# Altium schematic sheet Lamp_Section.SchDoc
size A4; DocumentNumber: 7; SheetNumber: 7; SheetTotal: 8
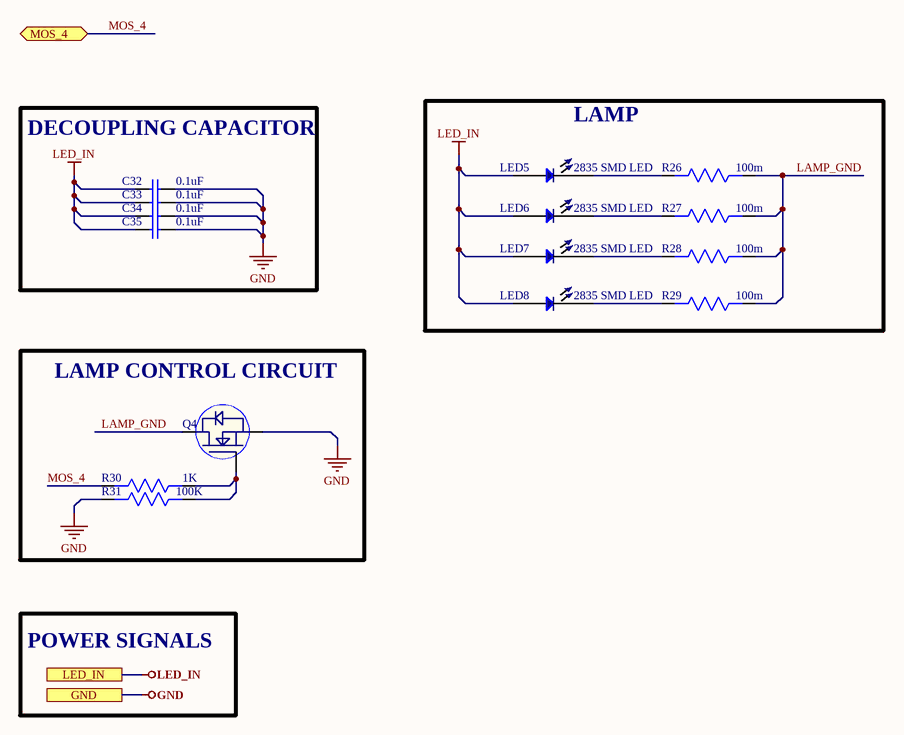
[diagram p0: Lamp_Section.SchDoc]

## Parts
C32  0.1uF  [Cap0603]
C33  0.1uF  [Cap0603]
C34  0.1uF  [Cap0603]
C35  0.1uF  [Cap0603]
LED5  2835 SMD LED  [2835 LED]
LED6  2835 SMD LED  [2835 LED]
LED7  2835 SMD LED  [2835 LED]
LED8  2835 SMD LED  [2835 LED]
Q4  DMN1045UFR4-7  [DMN1045UFR4-7]  (value not drawn)
R26  100m  [Res-1206]
R27  100m  [Res-1206]
R28  100m  [Res-1206]
R29  100m  [Res-1206]
R30  1K  [Res0603]
R31  100K  [Res0603]

## Blocks framed on the sheet
DECOUPLING CAPACITOR: C32-C35
LAMP: LED5-LED8 R26-R29
LAMP CONTROL CIRCUIT: Q4 R30 R31

## Ports
GND, LED_IN, MOS_4 (bidir)

## Nets
GND: C32.2 C33.2 C34.2 C35.2 Q4.2(S) R31.2 ; port GND
LED_IN: C32.1 C33.1 C34.1 C35.1 LED5.1 LED6.1 LED7.1 LED8.1 ; port LED_IN
LAMP_GND: Q4.3(D) R26.1 R27.1 R28.1 R29.1
MOS_4: R30.2 ; port MOS_4
NetLED5_2: LED5.2 R26.2
NetLED6_2: LED6.2 R27.2
NetLED7_2: LED7.2 R28.2
NetLED8_2: LED8.2 R29.2
NetQ4_1: Q4.1(G) R30.1 R31.1

## Notes on the sheet
- POWER SIGNALS

## Library data of the parts
C32-C35 = CC0603ZRY5V9BB104: CAP CER 0.1UF 50V Y5V 0603; Manufacturer: Yageo; Capacitance: 100nF; Tolerance: 80%; Supplier 1: Digi-Key; Manufacturer Part Number: CC0603ZRY5V9BB104; Stock 1: 15000880; Pricing 1: 1=0.1, 10=0.075, 100=0.0334, 500=0.02386, 1000=0.01874 (USD); Mount: Surface Mount; Case/Package: 0603; Number of Pins: 2; Case Code (Metric): 1608; Case Code (Imperial): 0603; Min Operating Temperature: -30°C; Max Operating Temperature: 85°C; Dielectric: Y5V; Voltage Rating: 50V; Package Quantity: 1; Packaging: Tape and Reel; Voltage Rating (DC): 50V; Termination: SMD/SMT; Composition: Ceramic; Voltage: 50V; Length: 1.6mm; Height: 0.8mm; Width: 0.031inch; Thickness: 0.035inch; Depth: 0.8mm; Radiation Hardening: No; REACH SVHC: No SVHC; Lead Free: Lead Free; Halogen Free: Halogen Free; ComponentLink1URL: http://www.yageo.com/documents/recent/UPY-GPHC_Y5V_6.3V-to-50V_8.pdf?src-supplier=Digi-Key; ComponentLink1Description: http://www.yageo.com/documents/recent/UPY-GPHC_Y5V_6.3V-to-50V_8.pdf?src-supplier=Digi-Key; ComponentLink2URL: http://www.yageo.com/documents/recent/UPY-GPHC_Y5V_6.3V-to-50V_5.pdf?src-supplier=Avnet+Europe; ComponentLink2Description: http://www.yageo.com/documents/recent/UPY-GPHC_Y5V_6.3V-to-50V_5.pdf?src-supplier=Avnet+Europe; ComponentLink3URL: https://www.verical.com/server-webapp/html/getDatasheet?partID=403611&src-supplier=Verical; ComponentLink3Description: https://www.verical.com/server-webapp/html/getDatasheet?partID=403611&src-supplier=Verical; ComponentLink4URL: http://www.mouser.com/ds/2/447/Yageo_UPY-GP_NP0_16V-to-50V_9-358835.pdf?src-supplier=Mouser; ComponentLink4Description: http://www.mouser.com/ds/2/447/Yageo_UPY-GP_NP0_16V-to-50V_9-358835.pdf?src-supplier=Mouser; ComponentLink5URL: http://www.farnell.com/datasheets/1132289.pdf?src-supplier=Element14; ComponentLink5Description: http://www.farnell.com/datasheets/1132289.pdf?src-supplier=Element14; Supplier Part Number 1: 311-1343-1-ND
LED5-LED8 = 2835 SMD LED: SMD LED 2835 Chips 1W 3V SMD; Manufacturer: ENLINCA; Max. Forward voltage: 3V; Package: 2835
Q4 = DMN1045UFR4-7: Mosfet N-ch 12V 3.2A 3-PIN X2-DFN T/r; Manufacturer: Diodes; Rds On Max: 45mR; Input Capacitance: 375pF; Max Power Dissipation: 500mW; Supplier 1: Digi-Key; Manufacturer Part Number: DMN1045UFR4-7; RoHS: Yes; Category: MOSFETs; Pricing 1: 1=0.50000, 10=0.37400, 100=0.23280, 500=0.15930, 1000=0.12254 (USD); Mount: Surface Mount; Number of Pins: 3; Min Operating Temperature: -55°C; Max Operating Temperature: 150°C; Packaging: Tape and Reel; Drain to Source Voltage (Vdss): 12V; Continuous Drain Current (ID): 3.2A; RoHS Compliant: Yes; ComponentLink1URL: http://www.mouser.com/ds/2/115/DMN1045UFR4-526244.pdf?src-supplier=Mouser; ComponentLink1Description: http://www.mouser.com/ds/2/115/DMN1045UFR4-526244.pdf?src-supplier=Mouser; ComponentLink2URL: https://www.diodes.com/assets/Datasheets/DMN1045UFR4.pdf?src-supplier=Digi-Key; ComponentLink2Description: https://www.diodes.com/assets/Datasheets/DMN1045UFR4.pdf?src-supplier=Digi-Key; Supplier Part Number 1: DMN1045UFR4-7DIDKR-ND
R26-R29 = ERJ8BWFR100V: RES SMD 1206 0.1 Ohm 1% 1W ±100ppm/°C; Manufacturer: Panasonic; Manufacturer Part Number: ERJ-8BWFR100V; Resistance: 100mR; Supplier 1: Digi-Key; RoHS: Yes; Category: Chip SMD Resistors; Stock 1: 71395; Pricing 1: 1=0.86000, 10=0.63400, 100=0.36940, 1000=0.20719, 2500=0.20002 (USD); Mount: Surface Mount; Case/Package: 1206; Number of Pins: 2; Contact Plating: Tin; Case Code (Metric): 3216; Case Code (Imperial): 1206; Size Code: 1206; Min Operating Temperature: -55°C; Max Operating Temperature: 155°C; Tolerance: 1%; Resistor Type: Thick Film,Low-Ohm-Resistor; Temperature Coefficient: 100ppm/°C; Power Rating: 1W; Packaging: Tape and Reel; Package Quantity: 1; Number of Terminations: 2; Termination: SMD/SMT; Max Power Dissipation: 1W; Features: Automotive AEC-Q200; Series: ERJ; Technology: THICK FILM; Resistance Tolerance: 1%; Construction: Rectangular; Length: 3.2mm; Width: 0.063inch; Height: 0.65mm; Depth: 1.6mm; Radiation Hardening: No; REACH SVHC: No SVHC; Military Standard: Not; Lead Free: Lead Free; RoHS Compliant: Yes; ComponentLink1URL: https://datasheet.ciiva.com/11812/0900766b8126441d-11812516.pdf?src-supplier=RSComponents; ComponentLink1Description: https://datasheet.ciiva.com/11812/0900766b8126441d-11812516.pdf?src-supplier=RSComponents; ComponentLink2URL: https://datasheet.ciiva.com/16212/erj-8bwfr100v-16212037.pdf?src-supplier=Future+Electronics; ComponentLink2Description: https://datasheet.ciiva.com/16212/erj-8bwfr100v-16212037.pdf?src-supplier=Future+Electronics; ComponentLink3URL: https://datasheet.ciiva.com/24072/aoa0000ce3-72189-24072813.pdf?src-supplier=Mouser; ComponentLink3Description: https://datasheet.ciiva.com/24072/aoa0000ce3-72189-24072813.pdf?src-supplier=Mouser; ComponentLink4URL: https://datasheet.ciiva.com/2451/aoa0000ce3-2451533.pdf?src-supplier=Digi-Key; ComponentLink4Description: https://datasheet.ciiva.com/2451/aoa0000ce3-2451533.pdf?src-supplier=Digi-Key; ComponentLink5URL: https://datasheet.ciiva.com/17208/aoa0000ce3-17208060.pdf?src-supplier=Avnet+Europe; ComponentLink5Description: https://datasheet.ciiva.com/17208/aoa0000ce3-17208060.pdf?src-supplier=Avnet+Europe; ComponentLink6URL: https://datasheet.ciiva.com/2451/aoa0000ce3-2451532.pdf?src-supplier=Digi-Key; ComponentLink6Description: https://datasheet.ciiva.com/2451/aoa0000ce3-2451532.pdf?src-supplier=Digi-Key; ComponentLink7URL: https://datasheet.ciiva.com/46386/1662788-46386715.pdf?src-supplier=Element14; ComponentLink7Description: https://datasheet.ciiva.com/46386/1662788-46386715.pdf?src-supplier=Element14; ComponentLink8URL: https://datasheet.ciiva.com/6137/1662788-6137674.pdf?src-supplier=Farnell; ComponentLink8Description: https://datasheet.ciiva.com/6137/1662788-6137674.pdf?src-supplier=Farnell; ComponentLink9URL: https://datasheet.ciiva.com/43455/1662788-43455193.pdf?src-supplier=Farnell; ComponentLink9Description: https://datasheet.ciiva.com/43455/1662788-43455193.pdf?src-supplier=Farnell; ComponentLink10URL: https://datasheet.ciiva.com/16787/70068852-16787433.pdf?src-supplier=Allied+Electronics; ComponentLink10Description: https://datasheet.ciiva.com/16787/70068852-16787433.pdf?src-supplier=Allied+Electronics; ComponentLink11URL: https://datasheet.ciiva.com/28667/39793-28667735.pdf?src-supplier=Element14; ComponentLink11Description: https://datasheet.ciiva.com/28667/39793-28667735.pdf?src-supplier=Element14; ComponentLink12URL: https://datasheet.ciiva.com/48516/erj-eng-tds-48516677.pdf?src-supplier=Distrelec; ComponentLink12Description: https://datasheet.ciiva.com/48516/erj-eng-tds-48516677.pdf?src-supplier=Distrelec; ComponentLink13URL: https://datasheet.ciiva.com/30092/6aoa0000ce3-30092213.pdf?src-supplier=Onlinecomponents.com; ComponentLink13Description: https://datasheet.ciiva.com/30092/6aoa0000ce3-30092213.pdf?src-supplier=Onlinecomponents.com; ComponentLink14URL: https://datasheet.ciiva.com/16783/70068852-16783653.pdf?src-supplier=Allied+Electronics; ComponentLink14Description: https://datasheet.ciiva.com/16783/70068852-16783653.pdf?src-supplier=Allied+Electronics; ComponentLink15URL: https://datasheet.ciiva.com/16780/70068852-16780101.pdf?src-supplier=Allied+Electronics; ComponentLink15Description: https://datasheet.ciiva.com/16780/70068852-16780101.pdf?src-supplier=Allied+Electronics; ComponentLink16URL: https://datasheet.ciiva.com/2451/aoa0000ce3-2451534.pdf?src-supplier=Digi-Key; ComponentLink16Description: https://datasheet.ciiva.com/2451/aoa0000ce3-2451534.pdf?src-supplier=Digi-Key; ComponentLink17URL: https://datasheet.ciiva.com/16516/aoa0000ce3-16516495.pdf?src-supplier=Avnet+Asia; ComponentLink17Description: https://datasheet.ciiva.com/16516/aoa0000ce3-16516495.pdf?src-supplier=Avnet+Asia; Supplier Part Number 1: P.10AUCT-ND
R30 = RC0603FR-071KL: RES SMD 1K OHM 1% 1/10W 0603; Manufacturer: Yageo; Resistance: 1kR; Temperature Coefficient: 100ppm/°C; Power Rating: 100mW; Voltage Rating: 50V; ComponentLink1URL: https://www.verical.com/server-webapp/html/getDatasheet?partID=409289&src-supplier=Verical; ComponentLink1Description: https://www.verical.com/server-webapp/html/getDatasheet?partID=409289&src-supplier=Verical; Supplier 1: Digi-Key; Manufacturer Part Number: RC0603FR-071KL; Stock 1: 21472395; Pricing 1: 1=0.1, 10=0.023, 100=0.0094, 1000=0.0042, 2500=0.0037 (USD); Case/Package: 0603; Contact Plating: Tin,Matte; Case Code (Imperial): 0603; Case Code (Metric): 1608; Min Operating Temperature: -55°C; Max Operating Temperature: 155°C; Tolerance: 1%; Composition: Thick Film; Packaging: Tape and Reel; Termination: SMD/SMT; Military Standard: Not; Length: 1.6mm; Height: 0.45mm; Depth: 0.8mm; Radiation Hardening: No; REACH SVHC: No SVHC; Lead Free: Lead Free; ComponentLink2URL: http://documents.rs-components.com/techlib://itc_doclist_GB.htm?stockno=5048928&src-supplier=RSComponents; ComponentLink2Description: http://documents.rs-components.com/techlib://itc_doclist_GB.htm?stockno=5048928&src-supplier=RSComponents; ComponentLink3URL: http://www.yageo.com/documents/recent/PYu-RC0603_51_RoHS_L_4.pdf?src-supplier=Avnet+Europe; ComponentLink3Description: http://www.yageo.com/documents/recent/PYu-RC0603_51_RoHS_L_4.pdf?src-supplier=Avnet+Europe; ComponentLink4URL: http://www.farnell.com/datasheets/2167052.pdf?src-supplier=Element14; ComponentLink4Description: http://www.farnell.com/datasheets/2167052.pdf?src-supplier=Element14; ComponentLink5URL: http://www.farnell.com/datasheets/1868787.pdf?src-supplier=Element14; ComponentLink5Description: http://www.farnell.com/datasheets/1868787.pdf?src-supplier=Element14; ComponentLink6URL: http://www.yageo.com/documents/recent/PYu-RC_Group_51_RoHS_L_2.pdf?src-supplier=Avnet; ComponentLink6Description: http://www.yageo.com/documents/recent/PYu-RC_Group_51_RoHS_L_2.pdf?src-supplier=Avnet; ComponentLink7URL: https://www.verical.com/server-webapp/html/getDatasheet?partID=404327&src-supplier=Verical; ComponentLink7Description: https://www.verical.com/server-webapp/html/getDatasheet?partID=404327&src-supplier=Verical; ComponentLink8URL: http://www.farnell.com/datasheets/443971.pdf?src-supplier=Element14; ComponentLink8Description: http://www.farnell.com/datasheets/443971.pdf?src-supplier=Element14; Supplier Part Number 1: 311-1.00KHRDKR-ND
R31 = RC0603FR-07100KL: RES SMD 100K OHM 1% 1/10W 0603